# Altium project MONO65_A2_Project.PrjPcb (part 2 of 2)

## Sheet MONO65_A2_s06 [LEDs].SchDoc
size A3; DocumentNumber: 6; SheetNumber: 6; SheetTotal: 7
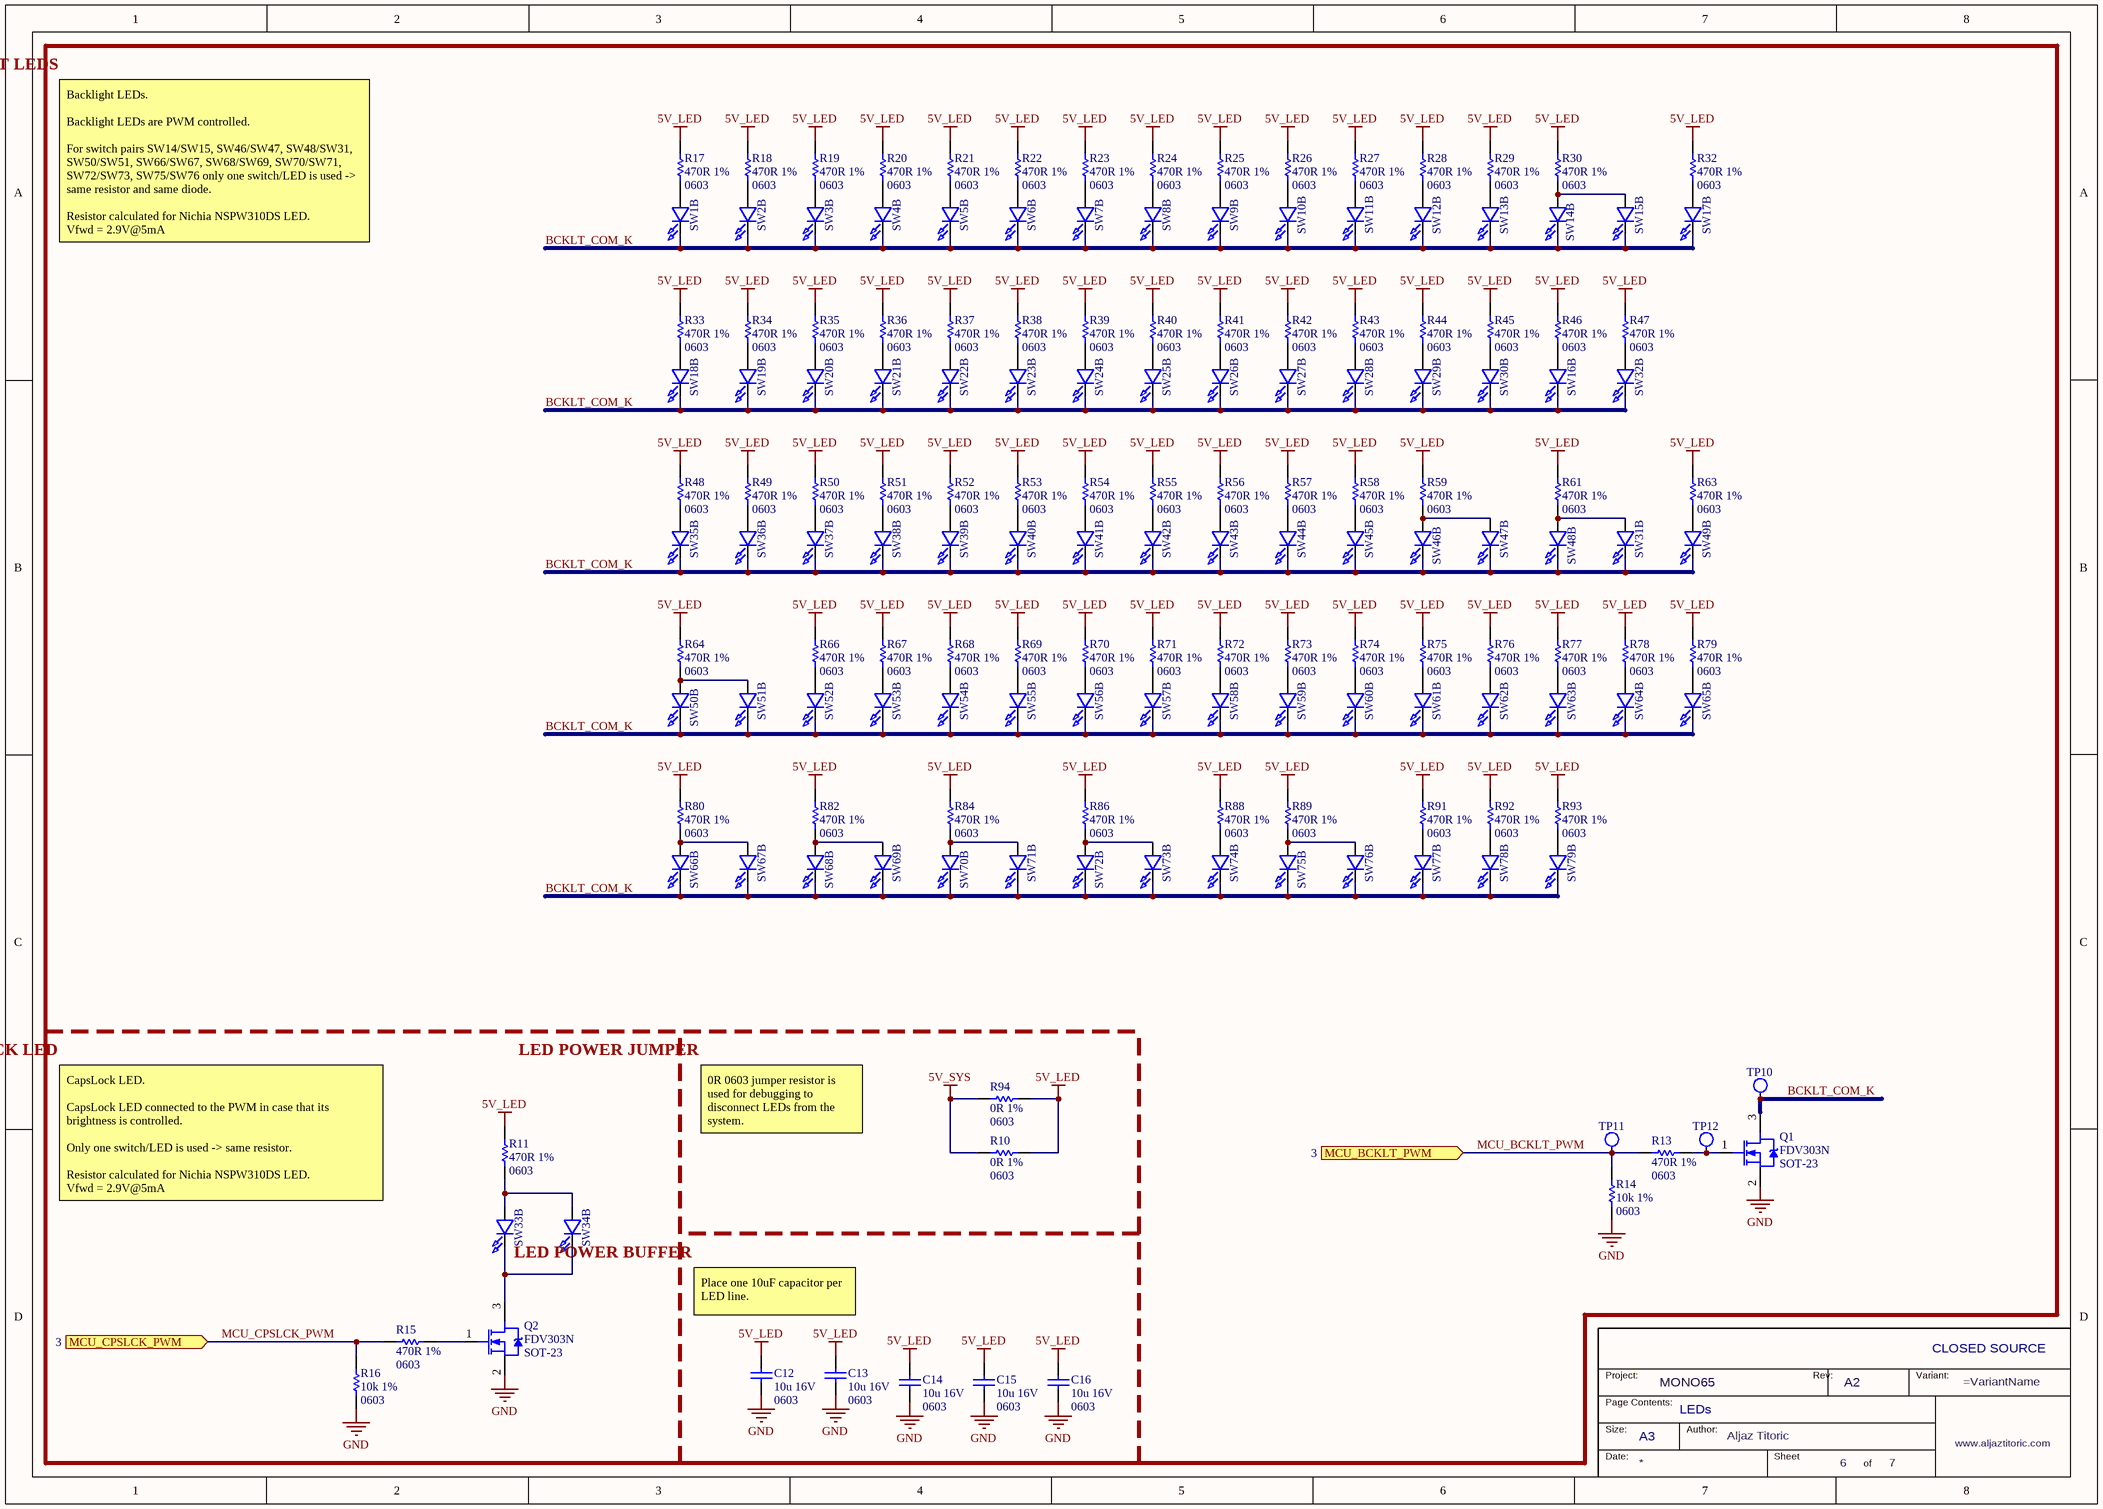
[diagram p5: MONO65_A2_s06 [LEDs].SchDoc]

### Parts
(Parts that share a designator on the sheet are numbered #1, #2 ... from top to bottom, then left to right.)
C12  10u 16V  Case/Package: 0603  [CAPC1608X08N]
C13  10u 16V  Case/Package: 0603  [CAPC1608X08N]
C14  10u 16V  Case/Package: 0603  [CAPC1608X08N]
C15  10u 16V  Case/Package: 0603  [CAPC1608X08N]
C16  10u 16V  Case/Package: 0603  [CAPC1608X08N]
Q1  FDV303N  Case/Package: SOT-23  [SOT95P235X110-3N]
Q2  FDV303N  Case/Package: SOT-23  [SOT95P235X110-3N]
R10  0R 1%  Case/Package: 0603  [RESC1608X04N]
R11  470R 1%  Case/Package: 0603  [RESC1608X04N]
R13  470R 1%  Case/Package: 0603  [RESC1608X04N]
R14  10k 1%  Case/Package: 0603  [RESC1608X04N]
R15  470R 1%  Case/Package: 0603  [RESC1608X04N]
R16  10k 1%  Case/Package: 0603  [RESC1608X04N]
R17  470R 1%  Case/Package: 0603  [RESC1608X04N]
R18  470R 1%  Case/Package: 0603  [RESC1608X04N]
R19  470R 1%  Case/Package: 0603  [RESC1608X04N]
R20  470R 1%  Case/Package: 0603  [RESC1608X04N]
R21  470R 1%  Case/Package: 0603  [RESC1608X04N]
R22  470R 1%  Case/Package: 0603  [RESC1608X04N]
R23  470R 1%  Case/Package: 0603  [RESC1608X04N]
R24  470R 1%  Case/Package: 0603  [RESC1608X04N]
R25  470R 1%  Case/Package: 0603  [RESC1608X04N]
R26  470R 1%  Case/Package: 0603  [RESC1608X04N]
R27  470R 1%  Case/Package: 0603  [RESC1608X04N]
R28  470R 1%  Case/Package: 0603  [RESC1608X04N]
R29  470R 1%  Case/Package: 0603  [RESC1608X04N]
R30  470R 1%  Case/Package: 0603  [RESC1608X04N]
R32  470R 1%  Case/Package: 0603  [RESC1608X04N]
R33  470R 1%  Case/Package: 0603  [RESC1608X04N]
R34  470R 1%  Case/Package: 0603  [RESC1608X04N]
R35  470R 1%  Case/Package: 0603  [RESC1608X04N]
R36  470R 1%  Case/Package: 0603  [RESC1608X04N]
R37  470R 1%  Case/Package: 0603  [RESC1608X04N]
R38  470R 1%  Case/Package: 0603  [RESC1608X04N]
R39  470R 1%  Case/Package: 0603  [RESC1608X04N]
R40  470R 1%  Case/Package: 0603  [RESC1608X04N]
R41  470R 1%  Case/Package: 0603  [RESC1608X04N]
R42  470R 1%  Case/Package: 0603  [RESC1608X04N]
R43  470R 1%  Case/Package: 0603  [RESC1608X04N]
R44  470R 1%  Case/Package: 0603  [RESC1608X04N]
R45  470R 1%  Case/Package: 0603  [RESC1608X04N]
R46  470R 1%  Case/Package: 0603  [RESC1608X04N]
R47  470R 1%  Case/Package: 0603  [RESC1608X04N]
R48  470R 1%  Case/Package: 0603  [RESC1608X04N]
R49  470R 1%  Case/Package: 0603  [RESC1608X04N]
R50  470R 1%  Case/Package: 0603  [RESC1608X04N]
R51  470R 1%  Case/Package: 0603  [RESC1608X04N]
R52  470R 1%  Case/Package: 0603  [RESC1608X04N]
R53  470R 1%  Case/Package: 0603  [RESC1608X04N]
R54  470R 1%  Case/Package: 0603  [RESC1608X04N]
R55  470R 1%  Case/Package: 0603  [RESC1608X04N]
R56  470R 1%  Case/Package: 0603  [RESC1608X04N]
R57  470R 1%  Case/Package: 0603  [RESC1608X04N]
R58  470R 1%  Case/Package: 0603  [RESC1608X04N]
R59  470R 1%  Case/Package: 0603  [RESC1608X04N]
R61  470R 1%  Case/Package: 0603  [RESC1608X04N]
R63  470R 1%  Case/Package: 0603  [RESC1608X04N]
R64  470R 1%  Case/Package: 0603  [RESC1608X04N]
R66  470R 1%  Case/Package: 0603  [RESC1608X04N]
R67  470R 1%  Case/Package: 0603  [RESC1608X04N]
R68  470R 1%  Case/Package: 0603  [RESC1608X04N]
R69  470R 1%  Case/Package: 0603  [RESC1608X04N]
R70  470R 1%  Case/Package: 0603  [RESC1608X04N]
R71  470R 1%  Case/Package: 0603  [RESC1608X04N]
R72  470R 1%  Case/Package: 0603  [RESC1608X04N]
R73  470R 1%  Case/Package: 0603  [RESC1608X04N]
R74  470R 1%  Case/Package: 0603  [RESC1608X04N]
R75  470R 1%  Case/Package: 0603  [RESC1608X04N]
R76  470R 1%  Case/Package: 0603  [RESC1608X04N]
R77  470R 1%  Case/Package: 0603  [RESC1608X04N]
R78  470R 1%  Case/Package: 0603  [RESC1608X04N]
R79  470R 1%  Case/Package: 0603  [RESC1608X04N]
R80  470R 1%  Case/Package: 0603  [RESC1608X04N]
R82  470R 1%  Case/Package: 0603  [RESC1608X04N]
R84  470R 1%  Case/Package: 0603  [RESC1608X04N]
R86  470R 1%  Case/Package: 0603  [RESC1608X04N]
R88  470R 1%  Case/Package: 0603  [RESC1608X04N]
R89  470R 1%  Case/Package: 0603  [RESC1608X04N]
R91  470R 1%  Case/Package: 0603  [RESC1608X04N]
R92  470R 1%  Case/Package: 0603  [RESC1608X04N]
R93  470R 1%  Case/Package: 0603  [RESC1608X04N]
R94  0R 1%  Case/Package: 0603  [RESC1608X04N]
SW1  MX1A-11GW  [MX1A-1-LED-Pins]  (value not drawn)  (part B of 2)
SW2  MX1A-11GW  [MX1A-1-LED-Pins]  (value not drawn)  (part B of 2)
SW3  MX1A-11GW  [MX1A-1-LED-Pins]  (value not drawn)  (part B of 2)
SW4  MX1A-11GW  [MX1A-1-LED-Pins]  (value not drawn)  (part B of 2)
SW5  MX1A-11GW  [MX1A-1-LED-Pins]  (value not drawn)  (part B of 2)
SW6  MX1A-11GW  [MX1A-1-LED-Pins]  (value not drawn)  (part B of 2)
SW7  MX1A-11GW  [MX1A-1-LED-Pins]  (value not drawn)  (part B of 2)
SW8  MX1A-11GW  [MX1A-1-LED-Pins]  (value not drawn)  (part B of 2)
SW9  MX1A-11GW  [MX1A-1-LED-Pins]  (value not drawn)  (part B of 2)
SW10  MX1A-11GW  [MX1A-1-LED-Pins]  (value not drawn)  (part B of 2)
SW11  MX1A-11GW  [MX1A-1-LED-Pins]  (value not drawn)  (part B of 2)
SW12  MX1A-11GW  [MX1A-1-LED-Pins]  (value not drawn)  (part B of 2)
SW13  MX1A-11GW  [MX1A-1-LED-Pins]  (value not drawn)  (part B of 2)
SW14  MX1A-11GW  [MX1A-1-LED-Pins]  (value not drawn)  (part B of 2)
SW15  MX1A-11GW  [MX1A-1-LED-Pins]  (value not drawn)  (part B of 2)
SW16  MX1A-11GW  [MX1A-1-LED-Pins]  (value not drawn)  (part B of 2)
SW17  MX1A-11GW  [MX1A-1-LED-Pins]  (value not drawn)  (part B of 2)
SW18  MX1A-11GW  [MX1A-1-LED-Pins]  (value not drawn)  (part B of 2)
SW19  MX1A-11GW  [MX1A-1-LED-Pins]  (value not drawn)  (part B of 2)
SW20  MX1A-11GW  [MX1A-1-LED-Pins]  (value not drawn)  (part B of 2)
SW21  MX1A-11GW  [MX1A-1-LED-Pins]  (value not drawn)  (part B of 2)
SW22  MX1A-11GW  [MX1A-1-LED-Pins]  (value not drawn)  (part B of 2)
SW23  MX1A-11GW  [MX1A-1-LED-Pins]  (value not drawn)  (part B of 2)
SW24  MX1A-11GW  [MX1A-1-LED-Pins]  (value not drawn)  (part B of 2)
SW25  MX1A-11GW  [MX1A-1-LED-Pins]  (value not drawn)  (part B of 2)
SW26  MX1A-11GW  [MX1A-1-LED-Pins]  (value not drawn)  (part B of 2)
SW27  MX1A-11GW  [MX1A-1-LED-Pins]  (value not drawn)  (part B of 2)
SW28  MX1A-11GW  [MX1A-1-LED-Pins]  (value not drawn)  (part B of 2)
SW29  MX1A-11GW  [MX1A-1-LED-Pins]  (value not drawn)  (part B of 2)
SW30  MX1A-11GW  [MX1A-1-LED-Pins]  (value not drawn)  (part B of 2)
SW31  MX1A-11GW  [MX1A-1-LED-Pins]  (value not drawn)  (part B of 2)
SW32  MX1A-11GW  [MX1A-1-LED-Pins]  (value not drawn)  (part B of 2)
SW33  MX1A-11GW  [MX1A-1-LED-Pins]  (value not drawn)  (part B of 2)
SW34  MX1A-11GW  [MX1A-1-LED-Pins]  (value not drawn)  (part B of 2)
SW35  MX1A-11GW  [MX1A-1-LED-Pins]  (value not drawn)  (part B of 2)
SW36  MX1A-11GW  [MX1A-1-LED-Pins]  (value not drawn)  (part B of 2)
SW37  MX1A-11GW  [MX1A-1-LED-Pins]  (value not drawn)  (part B of 2)
SW38  MX1A-11GW  [MX1A-1-LED-Pins]  (value not drawn)  (part B of 2)
SW39  MX1A-11GW  [MX1A-1-LED-Pins]  (value not drawn)  (part B of 2)
SW40  MX1A-11GW  [MX1A-1-LED-Pins]  (value not drawn)  (part B of 2)
SW41  MX1A-11GW  [MX1A-1-LED-Pins]  (value not drawn)  (part B of 2)
SW42  MX1A-11GW  [MX1A-1-LED-Pins]  (value not drawn)  (part B of 2)
SW43  MX1A-11GW  [MX1A-1-LED-Pins]  (value not drawn)  (part B of 2)
SW44  MX1A-11GW  [MX1A-1-LED-Pins]  (value not drawn)  (part B of 2)
SW45  MX1A-11GW  [MX1A-1-LED-Pins]  (value not drawn)  (part B of 2)
SW46  MX1A-11GW  [MX1A-1-LED-Pins]  (value not drawn)  (part B of 2)
SW47  MX1A-11GW  [MX1A-1-LED-Pins]  (value not drawn)  (part B of 2)
SW48  MX1A-11GW  [MX1A-1-LED-Pins]  (value not drawn)  (part B of 2)
SW49  MX1A-11GW  [MX1A-1-LED-Pins]  (value not drawn)  (part B of 2)
SW50  MX1A-11GW  [MX1A-1-LED-Pins]  (value not drawn)  (part B of 2)
SW51  MX1A-11GW  [MX1A-1-LED-Pins]  (value not drawn)  (part B of 2)
SW52  MX1A-11GW  [MX1A-1-LED-Pins]  (value not drawn)  (part B of 2)
SW53  MX1A-11GW  [MX1A-1-LED-Pins]  (value not drawn)  (part B of 2)
SW54  MX1A-11GW  [MX1A-1-LED-Pins]  (value not drawn)  (part B of 2)
SW55  MX1A-11GW  [MX1A-1-LED-Pins]  (value not drawn)  (part B of 2)
SW56  MX1A-11GW  [MX1A-1-LED-Pins]  (value not drawn)  (part B of 2)
SW57  MX1A-11GW  [MX1A-1-LED-Pins]  (value not drawn)  (part B of 2)
SW58  MX1A-11GW  [MX1A-1-LED-Pins]  (value not drawn)  (part B of 2)
SW59  MX1A-11GW  [MX1A-1-LED-Pins]  (value not drawn)  (part B of 2)
SW60  MX1A-11GW  [MX1A-1-LED-Pins]  (value not drawn)  (part B of 2)
SW61  MX1A-11GW  [MX1A-1-LED-Pins]  (value not drawn)  (part B of 2)
SW62  MX1A-11GW  [MX1A-1-LED-Pins]  (value not drawn)  (part B of 2)
SW63  MX1A-11GW  [MX1A-1-LED-Pins]  (value not drawn)  (part B of 2)
SW64  MX1A-11GW  [MX1A-1-LED-Pins]  (value not drawn)  (part B of 2)
SW65  MX1A-11GW  [MX1A-1-LED-Pins]  (value not drawn)  (part B of 2)
SW66  MX1A-11GW  [MX1A-1-LED-Pins]  (value not drawn)  (part B of 2)
SW67  MX1A-11GW  [MX1A-1-reversed LED-Pins]  (value not drawn)  (part B of 2)
SW68  MX1A-11GW  [MX1A-1-LED-Pins]  (value not drawn)  (part B of 2)
SW69  MX1A-11GW  [MX1A-1-reversed LED-Pins]  (value not drawn)  (part B of 2)
SW70  MX1A-11GW  [MX1A-1-LED-Pins]  (value not drawn)  (part B of 2)
SW71  MX1A-11GW  [MX1A-1-reversed LED-Pins]  (value not drawn)  (part B of 2)
SW72  MX1A-11GW  [MX1A-1-LED-Pins]  (value not drawn)  (part B of 2)
SW73  MX1A-11GW  [MX1A-1-LED-Pins]  (value not drawn)  (part B of 2)
SW74  MX1A-11GW  [MX1A-1-LED-Pins]  (value not drawn)  (part B of 2)
SW75  MX1A-11GW  [MX1A-1-LED-Pins]  (value not drawn)  (part B of 2)
SW76  MX1A-11GW  [MX1A-1-reversed LED-Pins]  (value not drawn)  (part B of 2)
SW77  MX1A-11GW  [MX1A-1-LED-Pins]  (value not drawn)  (part B of 2)
SW78  MX1A-11GW  [MX1A-1-LED-Pins]  (value not drawn)  (part B of 2)
SW79  MX1A-11GW  [MX1A-1-LED-Pins]  (value not drawn)  (part B of 2)
TB*?#5  PageContents: LEDs  Licence: CLOSED SOURCE  Size: A3  (hidden comment: TBL TitleBlock 01)  (graphical)
TP10  TP SMD 0.6mm  [TP SMD 0.6mm]  (value not drawn)  (no BOM)
TP11  TP SMD 0.6mm  [TP SMD 0.6mm]  (value not drawn)  (no BOM)
TP12  TP SMD 0.6mm  [TP SMD 0.6mm]  (value not drawn)  (no BOM)

### Ports
MCU_BCKLT_PWM (in, see 3), MCU_CPSLCK_PWM (in, see 3)

### Nets
5V_LED: C12.1 C13.1 C14.1 C15.1 C16.1 R10.2 R11.1 R17.1 R18.1 R19.1 R20.1 R21.1 R22.1 R23.1 R24.1 R25.1 R26.1 R27.1 R28.1 R29.1 R30.1 R32.1 R33.1 R34.1 R35.1 R36.1 R37.1 R38.1 R39.1 R40.1 R41.1 R42.1 R43.1 R44.1 R45.1 R46.1 R47.1 R48.1 R49.1 R50.1 R51.1 R52.1 R53.1 R54.1 R55.1 R56.1 R57.1 R58.1 R59.1 R61.1 R63.1 R64.1 R66.1 R67.1 R68.1 R69.1 R70.1 R71.1 R72.1 R73.1 R74.1 R75.1 R76.1 R77.1 R78.1 R79.1 R80.1 R82.1 R84.1 R86.1 R88.1 R89.1 R91.1 R92.1 R93.1 R94.2
5V_SYS: R10.1 R94.1
GND: C12.2 C13.2 C14.2 C15.2 C16.2 Q1.2(S) Q2.2(S) R14.2 R16.2
BCKLT_COM_K: Q1.3(D) SW1.4(K) SW2.4(K) SW3.4(K) SW4.4(K) SW5.4(K) SW6.4(K) SW7.4(K) SW8.4(K) SW9.4(K) SW10.4(K) SW11.4(K) SW12.4(K) SW13.4(K) SW14.4(K) SW15.4(K) SW16.4(K) SW17.4(K) SW18.4(K) SW19.4(K) SW20.4(K) SW21.4(K) SW22.4(K) SW23.4(K) SW24.4(K) SW25.4(K) SW26.4(K) SW27.4(K) SW28.4(K) SW29.4(K) SW30.4(K) SW31.4(K) SW32.4(K) SW35.4(K) SW36.4(K) SW37.4(K) SW38.4(K) SW39.4(K) SW40.4(K) SW41.4(K) SW42.4(K) SW43.4(K) SW44.4(K) SW45.4(K) SW46.4(K) SW47.4(K) SW48.4(K) SW49.4(K) SW50.4(K) SW51.4(K) SW52.4(K) SW53.4(K) SW54.4(K) SW55.4(K) SW56.4(K) SW57.4(K) SW58.4(K) SW59.4(K) SW60.4(K) SW61.4(K) SW62.4(K) SW63.4(K) SW64.4(K) SW65.4(K) SW66.4(K) SW67.4(K) SW68.4(K) SW69.4(K) SW70.4(K) SW71.4(K) SW72.4(K) SW73.4(K) SW74.4(K) SW75.4(K) SW76.4(K) SW77.4(K) SW78.4(K) SW79.4(K) TP10.1
MCU_BCKLT_PWM: R13.1 R14.1 TP11.1 ; port MCU_BCKLT_PWM
MCU_CPSLCK_PWM: R15.1 R16.1 ; port MCU_CPSLCK_PWM
NetQ1_1: Q1.1(G) R13.2 TP12.1
NetQ2_1: Q2.1(G) R15.2
NetQ2_3: Q2.3(D) SW33.4(K) SW34.4(K)
NetR11_2: R11.2 SW33.3(A) SW34.3(A)
NetR17_2: R17.2 SW1.3(A)
NetR18_2: R18.2 SW2.3(A)
NetR19_2: R19.2 SW3.3(A)
NetR20_2: R20.2 SW4.3(A)
NetR21_2: R21.2 SW5.3(A)
NetR22_2: R22.2 SW6.3(A)
NetR23_2: R23.2 SW7.3(A)
NetR24_2: R24.2 SW8.3(A)
NetR25_2: R25.2 SW9.3(A)
NetR26_2: R26.2 SW10.3(A)
NetR27_2: R27.2 SW11.3(A)
NetR28_2: R28.2 SW12.3(A)
NetR29_2: R29.2 SW13.3(A)
NetR30_2: R30.2 SW14.3(A) SW15.3(A)
NetR32_2: R32.2 SW17.3(A)
NetR33_2: R33.2 SW18.3(A)
NetR34_2: R34.2 SW19.3(A)
NetR35_2: R35.2 SW20.3(A)
NetR36_2: R36.2 SW21.3(A)
NetR37_2: R37.2 SW22.3(A)
NetR38_2: R38.2 SW23.3(A)
NetR39_2: R39.2 SW24.3(A)
NetR40_2: R40.2 SW25.3(A)
NetR41_2: R41.2 SW26.3(A)
NetR42_2: R42.2 SW27.3(A)
NetR43_2: R43.2 SW28.3(A)
NetR44_2: R44.2 SW29.3(A)
NetR45_2: R45.2 SW30.3(A)
NetR46_2: R46.2 SW16.3(A)
NetR47_2: R47.2 SW32.3(A)
NetR48_2: R48.2 SW35.3(A)
NetR49_2: R49.2 SW36.3(A)
NetR50_2: R50.2 SW37.3(A)
NetR51_2: R51.2 SW38.3(A)
NetR52_2: R52.2 SW39.3(A)
NetR53_2: R53.2 SW40.3(A)
NetR54_2: R54.2 SW41.3(A)
NetR55_2: R55.2 SW42.3(A)
NetR56_2: R56.2 SW43.3(A)
NetR57_2: R57.2 SW44.3(A)
NetR58_2: R58.2 SW45.3(A)
NetR59_2: R59.2 SW46.3(A) SW47.3(A)
NetR61_2: R61.2 SW31.3(A) SW48.3(A)
NetR63_2: R63.2 SW49.3(A)
NetR64_2: R64.2 SW50.3(A) SW51.3(A)
NetR66_2: R66.2 SW52.3(A)
NetR67_2: R67.2 SW53.3(A)
NetR68_2: R68.2 SW54.3(A)
NetR69_2: R69.2 SW55.3(A)
NetR70_2: R70.2 SW56.3(A)
NetR71_2: R71.2 SW57.3(A)
NetR72_2: R72.2 SW58.3(A)
NetR73_2: R73.2 SW59.3(A)
NetR74_2: R74.2 SW60.3(A)
NetR75_2: R75.2 SW61.3(A)
NetR76_2: R76.2 SW62.3(A)
NetR77_2: R77.2 SW63.3(A)
NetR78_2: R78.2 SW64.3(A)
NetR79_2: R79.2 SW65.3(A)
NetR80_2: R80.2 SW66.3(A) SW67.3(A)
NetR82_2: R82.2 SW68.3(A) SW69.3(A)
NetR84_2: R84.2 SW70.3(A) SW71.3(A)
NetR86_2: R86.2 SW72.3(A) SW73.3(A)
NetR88_2: R88.2 SW74.3(A)
NetR89_2: R89.2 SW75.3(A) SW76.3(A)
NetR91_2: R91.2 SW77.3(A)
NetR92_2: R92.2 SW78.3(A)
NetR93_2: R93.2 SW79.3(A)

### Notes on the sheet
- BACKLIGHT LEDS
- Backlight LEDs.
  Backlight LEDs are PWM controlled.
  For switch pairs SW14/SW15, SW46/SW47, SW48/SW31, SW50/SW51, SW66/SW67, SW68/SW69, SW70/SW71, SW72/SW73, SW75/SW76 only one switch/LED is used -> same resistor and same diode.
  Resistor calculated for Nichia NSPW310DS LED.
  Vfwd = 2.9V@5mA
- CAPS LOCK LED
- LED POWER JUMPER
- 0R 0603 jumper resistor is used for debugging to disconnect LEDs from the system.
- CapsLock LED.
  CapsLock LED connected to the PWM in case that its brightness is controlled.
  Only one switch/LED is used -> same resistor.
  Resistor calculated for Nichia NSPW310DS LED.
  Vfwd = 2.9V@5mA
- LED POWER BUFFER
- Place one 10uF capacitor per LED line.
- (in symbol TBL TitleBlock 01) Project:; Rev:; Variant:; Page Contents:; Size:; Author:; Date:; Sheet; of

### Library data of the parts
C12-C16 = CAP SMD CER 10u 16V X5R 0603: SMD CAPACITOR,10u, 16V, X5R, 0603; Manufacturer: Murata; Manufacturer Part Number: GRM188R61C106MA73D; Capacitance: 10uF; Tolerance: 20%; Supplier 1: Digi-Key; Stock 1: 24451; Pricing 1: 1 = 0,31000, 10 = 0,21500, 50 = 0,14340, 100 = 0,12190, 500 = 0,08604, 1000 = 0,07528 (USD); RoHS: Yes; Mount: Surface Mount; Case Code (Metric): 1608; Case Code (Imperial): 0603; Min Operating Temperature: -55°C; Max Operating Temperature: 85°C; Package Quantity: 4000; Packaging: Tape and Reel; Voltage Rating: 16V; Dielectric: X5R; Voltage: 16V; Voltage Rating (DC): 16V; Series: GRM; Length: 1.6mm; Width: 0.031inch; Height: 0.8mm; Thickness: 0.031inch; Depth: 0.8mm; REACH SVHC: No SVHC; Lead Free: Lead Free; RoHS Compliant: Yes; ComponentLink1URL: https://datasheet.ciiva.com/46444/1769893-46444981.pdf?src-supplier=Element14; ComponentLink1Description: https://datasheet.ciiva.com/46444/1769893-46444981.pdf?src-supplier=Element14; ComponentLink2URL: https://datasheet.ciiva.com/14906/partnumbering-e-01-14906479.pdf?src-supplier=Digi-Key; ComponentLink2Description: https://datasheet.ciiva.com/14906/partnumbering-e-01-14906479.pdf?src-supplier=Digi-Key; Supplier Part Number 1: 490-7201-1-ND
Q1 Q2 = SEM MOS N-CH 25V 680mA FDV303N: N-Channel MOSFET, 680 mA, 25 V, SOT-23-3, ON Semiconductor FDV303N; Manufacturer: ON Semiconductor / Fairchild; Rise Time: 8.5ns; Element Configuration: Single; Continuous Drain Current (ID): 680mA; Drain to Source Breakdown Voltage: 25V; Gate to Source Voltage (Vgs): 8V; Drain to Source Resistance: 450mR; Power Dissipation: 350mW; Turn-Off Delay Time: 17ns; Input Capacitance: 50pF; Turn-On Delay Time: 3ns; Nominal Vgs: 800mV; Number of Elements: 1; Current: 12A; Voltage: 20V; Supplier 1: Digi-Key; Manufacturer Part Number: FDV303N; Stock 1: 569121; Pricing 1: 1 = 0,36000, 10 = 0,29600, 25 = 0,24760, 100 = 0,12100, 250 = 0,11908, 500 = 0,10092, 1000 = 0,07013 (USD); RoHS: Yes; Mount: Surface Mount; Number of Pins: 3; Contact Plating: Tin,Matte; Min Operating Temperature: -55°C; Max Operating Temperature: 150°C; Packaging: Tape and Reel; Fall Time: 8.5ns; Package Quantity: 1; Rds On Max: 450mR; Max Power Dissipation: 350mW; Drain to Source Voltage (Vdss): 25V; Threshold Voltage: 800mV; Voltage Rating (DC): 25V; Current Rating: 680mA; On-State Resistance: 450mR; Dual Supply Voltage: 25V; Termination: SMD/SMT; Length: 2.92mm; Height: 0.93mm; Width: 3.05mm; Radiation Hardening: No; REACH SVHC: No SVHC; Lead Free: Lead Free; ComponentLink1URL: https://datasheet.ciiva.com/15137/getdatasheetpartid-90649-15137711.pdf?src-supplier=Verical; ComponentLink1Description: https://datasheet.ciiva.com/15137/getdatasheetpartid-90649-15137711.pdf?src-supplier=Verical; ComponentLink2URL: https://datasheet.ciiva.com/8114/fdv303n-8114704.pdf?src-supplier=Avnet; ComponentLink2Description: https://datasheet.ciiva.com/8114/fdv303n-8114704.pdf?src-supplier=Avnet; ComponentLink3URL: https://datasheet.ciiva.com/13052/fdv303n-108963-13052385.pdf?src-supplier=Mouser; ComponentLink3Description: https://datasheet.ciiva.com/13052/fdv303n-108963-13052385.pdf?src-supplier=Mouser; ComponentLink4URL: https://datasheet.ciiva.com/22681/1845307-22681736.pdf?src-supplier=Element14; ComponentLink4Description: https://datasheet.ciiva.com/22681/1845307-22681736.pdf?src-supplier=Element14; ComponentLink5URL: https://datasheet.ciiva.com/34301/871092-34301626.pdf?src-supplier=Jameco; ComponentLink5Description: https://datasheet.ciiva.com/34301/871092-34301626.pdf?src-supplier=Jameco; ComponentLink6URL: https://datasheet.ciiva.com/931/fdv303n-931809.pdf?src-supplier=Digi-Key; ComponentLink6Description: https://datasheet.ciiva.com/931/fdv303n-931809.pdf?src-supplier=Digi-Key; ComponentLink7URL: https://datasheet.ciiva.com/6037/fdv303n-6037406.pdf?src-supplier=Farnell; ComponentLink7Description: https://datasheet.ciiva.com/6037/fdv303n-6037406.pdf?src-supplier=Farnell; ComponentLink8URL: https://datasheet.ciiva.com/931/fdv303n-931810.pdf?src-supplier=Digi-Key; ComponentLink8Description: https://datasheet.ciiva.com/931/fdv303n-931810.pdf?src-supplier=Digi-Key; ComponentLink9URL: https://datasheet.ciiva.com/931/fdv303n-931811.pdf?src-supplier=Digi-Key; ComponentLink9Description: https://datasheet.ciiva.com/931/fdv303n-931811.pdf?src-supplier=Digi-Key; ComponentLink10URL: https://datasheet.ciiva.com/14092/fdv303n-eng-tds-14092037.pdf?src-supplier=Distrelec; ComponentLink10Description: https://datasheet.ciiva.com/14092/fdv303n-eng-tds-14092037.pdf?src-supplier=Distrelec; ComponentLink11URL: https://datasheet.ciiva.com/16958/fdv303n-16958487.pdf?src-supplier=Future+Electronics; ComponentLink11Description: https://datasheet.ciiva.com/16958/fdv303n-16958487.pdf?src-supplier=Future+Electronics; ComponentLink12URL: https://datasheet.ciiva.com/6037/fdv303n-6037404.pdf?src-supplier=Farnell; ComponentLink12Description: https://datasheet.ciiva.com/6037/fdv303n-6037404.pdf?src-supplier=Farnell; ComponentLink13URL: https://datasheet.ciiva.com/8114/fdv303n-8114700.pdf?src-supplier=Avnet; ComponentLink13Description: https://datasheet.ciiva.com/8114/fdv303n-8114700.pdf?src-supplier=Avnet; Supplier Part Number 1: FDV303NCT-ND
R10 R94 = RES SMD 0R 1% 0603: SMD RESISTOR 0R 1% 0603 0.1W; Manufacturer: Yageo; Manufacturer Part Number: RC0603JR-070RL; Resistance: 0mR; Power Rating: 100mW; Voltage Rating: 50V; Temperature Coefficient: 200ppm/°C; Supplier 1: Digi-Key; Stock 1: 22182575; Pricing 1: 1 = 0,10000, 10 = 0,01900, 25 = 0,01360, 50 = 0,01040, 100 = 0,00770, 250 = 0,00588, 500 = 0,00472, 1000 = 0,00347 (USD); RoHS: Yes; Number of Pins: 2; Case Code (Imperial): 0603; Case Code (Metric): 1608; Contact Plating: Tin,Matte; Min Operating Temperature: -55°C; Max Operating Temperature: 155°C; Packaging: Tape and Reel; Voltage Rating (DC): 50V; Composition: Thick Film; Tolerance: 1%; Military Standard: Not; Package Quantity: 5000; Termination: SMD/SMT; Length: 1.6mm; Height: 0.45mm; Width: 0.8mm; Depth: 0.8mm; Radiation Hardening: No; REACH SVHC: No SVHC; Lead Free: Lead Free; ComponentLink1URL: https://datasheet.ciiva.com/11808/pyu-r-int-6-11808700.pdf?src-supplier=RSComponents; ComponentLink1Description: https://datasheet.ciiva.com/11808/pyu-r-int-6-11808700.pdf?src-supplier=RSComponents; ComponentLink2URL: https://datasheet.ciiva.com/7746/1738695-7746421.pdf?src-supplier=Element14; ComponentLink2Description: https://datasheet.ciiva.com/7746/1738695-7746421.pdf?src-supplier=Element14; ComponentLink3URL: https://datasheet.ciiva.com/8883/pyu-rc0603-51-rohs-l-4-8883045.pdf?src-supplier=Avnet; ComponentLink3Description: https://datasheet.ciiva.com/8883/pyu-rc0603-51-rohs-l-4-8883045.pdf?src-supplier=Avnet; ComponentLink4URL: https://datasheet.ciiva.com/15189/getdatasheetpartid-329462-15189845.pdf?src-supplier=Verical; ComponentLink4Description: https://datasheet.ciiva.com/15189/getdatasheetpartid-329462-15189845.pdf?src-supplier=Verical; ComponentLink5URL: https://datasheet.ciiva.com/7746/1738695-7746422.pdf?src-supplier=Element14; ComponentLink5Description: https://datasheet.ciiva.com/7746/1738695-7746422.pdf?src-supplier=Element14; ComponentLink6URL: https://datasheet.ciiva.com/12555/rc0603-272842-12555254.pdf?src-supplier=Mouser; ComponentLink6Description: https://datasheet.ciiva.com/12555/rc0603-272842-12555254.pdf?src-supplier=Mouser; ComponentLink7URL: https://datasheet.ciiva.com/22747/443971-22747530.pdf?src-supplier=Element14; ComponentLink7Description: https://datasheet.ciiva.com/22747/443971-22747530.pdf?src-supplier=Element14; Supplier Part Number 1: 311-0.0GRDKR-ND
R11 R13 R15 R17-R30 R32-R59 R61 R63 R64 R66-R80 R82 R84 R86 R88 R89 R91-R93 = RES SMD 470R 1% 0603: SMD RESISTOR 470R 1% 0603 0.1W; Manufacturer: Yageo; Manufacturer Part Number: RC0603FR-07470RL; Power Rating: 100mW; Voltage Rating: 50V; Temperature Coefficient: 100ppm/°C; Working Voltage: 75V; Supplier 1: Digi-Key; Stock 1: 512962; Pricing 1: 1 = 0,10000, 10 = 0,02300, 100 = 0,00930, 1000 = 0,00417, 2500 = 0,00362 (USD); RoHS: Yes; Case Code (Metric): 1608; Case Code (Imperial): 0603; Min Operating Temperature: -55°C; Max Operating Temperature: 155°C; Tolerance: 1%; Resistance: 470R; Packaging: Tape and Reel; Package Quantity: 1; Resistor Type: Thick Film; Number of Terminations: 2; Termination: SMD/SMT; Max Power Dissipation: 100mW; Features: Moisture Resistant; Series: RC; Technology: THICK FILM; Resistance Tolerance: 1%; Construction: Rectangular; Length: 1.6mm; Width: 0.031inch; Height: 0.022inch; Depth: 0.8mm; RoHS Compliant: Yes; REACH SVHC: No SVHC; Military Standard: Not; Lead Free: Lead Free; ComponentLink1URL: https://datasheet.ciiva.com/11808/0900766b80f96399-11808177.pdf?src-supplier=RSComponents; ComponentLink1Description: https://datasheet.ciiva.com/11808/0900766b80f96399-11808177.pdf?src-supplier=RSComponents; ComponentLink2URL: https://datasheet.ciiva.com/7746/1738695-7746359.pdf?src-supplier=Element14; ComponentLink2Description: https://datasheet.ciiva.com/7746/1738695-7746359.pdf?src-supplier=Element14; ComponentLink3URL: https://datasheet.ciiva.com/7746/1738695-7746360.pdf?src-supplier=Element14; ComponentLink3Description: https://datasheet.ciiva.com/7746/1738695-7746360.pdf?src-supplier=Element14; ComponentLink4URL: https://datasheet.ciiva.com/7660/1868787-7660793.pdf?src-supplier=Element14; ComponentLink4Description: https://datasheet.ciiva.com/7660/1868787-7660793.pdf?src-supplier=Element14; ComponentLink5URL: https://datasheet.ciiva.com/46440/1868787-46440907.pdf?src-supplier=Element14; ComponentLink5Description: https://datasheet.ciiva.com/46440/1868787-46440907.pdf?src-supplier=Element14; ComponentLink6URL: https://datasheet.ciiva.com/2454/pyu-r-int-thick-7-2454012.pdf?src-supplier=Digi-Key; ComponentLink6Description: https://datasheet.ciiva.com/2454/pyu-r-int-thick-7-2454012.pdf?src-supplier=Digi-Key; ComponentLink7URL: https://datasheet.ciiva.com/2454/pyu-r-int-thick-7-2454013.pdf?src-supplier=Digi-Key; ComponentLink7Description: https://datasheet.ciiva.com/2454/pyu-r-int-thick-7-2454013.pdf?src-supplier=Digi-Key; ComponentLink8URL: https://datasheet.ciiva.com/2454/pyu-r-int-thick-7-2454014.pdf?src-supplier=Digi-Key; ComponentLink8Description: https://datasheet.ciiva.com/2454/pyu-r-int-thick-7-2454014.pdf?src-supplier=Digi-Key; Supplier Part Number 1: 311-470HRCT-ND
R14 R16 = RES SMD 10k 1% 0603: SMD RESISTOR 10k 1% 0603 0.1W; Manufacturer: Panasonic; Manufacturer Part Number: ERJ-3EKF1002V; Resistance: 10kR; Power Rating: 100mW; Temperature Coefficient: 100ppm/°C; Voltage Rating: 75V; Supplier 1: Digi-Key; Stock 1: 1973326; Pricing 1: 1 = 0,10000, 10 = 0,06000, 100 = 0,02440, 1000 = 0,01094, 2500 = 0,00950 (USD); RoHS: Yes; Mount: Surface Mount; Number of Pins: 2; Case Code (Metric): 1608; Case Code (Imperial): 0603; Contact Plating: Tin; Min Operating Temperature: -55°C; Max Operating Temperature: 155°C; Tolerance: 1%; Packaging: Tape and Reel; Composition: Thick Film; Termination: SMD/SMT; Package Quantity: 1; Max Power Dissipation: 100mW; Military Standard: Not; Number of Terminations: 2; Voltage Rating (DC): 75V; Features: Automotive AEC-Q200; Length: 1.6mm; Height: 0.45mm; Width: 0.031inch; Depth: 0.8mm; Radiation Hardening: No; Lead Free: Lead Free; REACH SVHC: No SVHC; ComponentLink1URL: https://datasheet.ciiva.com/7830/aoa0000ce2-7830729.pdf?src-supplier=Element14; ComponentLink1Description: https://datasheet.ciiva.com/7830/aoa0000ce2-7830729.pdf?src-supplier=Element14; ComponentLink2URL: https://datasheet.ciiva.com/17212/aoa0000ce2-17212105.pdf?src-supplier=Avnet+Europe; ComponentLink2Description: https://datasheet.ciiva.com/17212/aoa0000ce2-17212105.pdf?src-supplier=Avnet+Europe; ComponentLink3URL: https://datasheet.ciiva.com/48530/aoa0000ce2-48530988.pdf?src-supplier=Avnet; ComponentLink3Description: https://datasheet.ciiva.com/48530/aoa0000ce2-48530988.pdf?src-supplier=Avnet; ComponentLink4URL: https://datasheet.ciiva.com/24070/aoa0000ce2-24070318.pdf?src-supplier=Mouser; ComponentLink4Description: https://datasheet.ciiva.com/24070/aoa0000ce2-24070318.pdf?src-supplier=Mouser; ComponentLink5URL: https://datasheet.ciiva.com/16759/70260748-16759807.pdf?src-supplier=Allied+Electronics; ComponentLink5Description: https://datasheet.ciiva.com/16759/70260748-16759807.pdf?src-supplier=Allied+Electronics; ComponentLink6URL: https://datasheet.ciiva.com/16511/aoa0000ce2-16511861.pdf?src-supplier=Avnet+Asia; ComponentLink6Description: https://datasheet.ciiva.com/16511/aoa0000ce2-16511861.pdf?src-supplier=Avnet+Asia; ComponentLink7URL: https://datasheet.ciiva.com/46372/1678782-46372725.pdf?src-supplier=Element14; ComponentLink7Description: https://datasheet.ciiva.com/46372/1678782-46372725.pdf?src-supplier=Element14; ComponentLink8URL: https://datasheet.ciiva.com/28514/426256-28514198.pdf?src-supplier=Element14; ComponentLink8Description: https://datasheet.ciiva.com/28514/426256-28514198.pdf?src-supplier=Element14; ComponentLink9URL: https://datasheet.ciiva.com/9194/aoa0000ce2-9194199.pdf?src-supplier=Avnet; ComponentLink9Description: https://datasheet.ciiva.com/9194/aoa0000ce2-9194199.pdf?src-supplier=Avnet; ComponentLink10URL: https://datasheet.ciiva.com/30208/aoa0000ce2-30208985.pdf?src-supplier=Onlinecomponents.com; ComponentLink10Description: https://datasheet.ciiva.com/30208/aoa0000ce2-30208985.pdf?src-supplier=Onlinecomponents.com; Supplier Part Number 1: P10.0KHDKR-ND
SW1-SW79 = SW MX1A-11GW: Cherry MX switch, 1-pole w/LED, w/fixation pins, GREEN LED; Supplier 1: Digi-Key; Manufacturer: Cherry; Manufacturer Part Number: MX1A-11GW; Stock 1: 0; Pricing 1: 8000 = 1,62196 (USD); RoHS: No; Supplier Part Number 1: MX1A-11GW-ND
TB*?#5 = TBL TitleBlock 01: Custom Title block
TP10-TP12 = TPT SMD 60: Test Point SMD 0.6mm

## Sheet MONO65_A2_s07 [PSU].SchDoc
size A3; DocumentNumber: 7; SheetNumber: 7; SheetTotal: 7
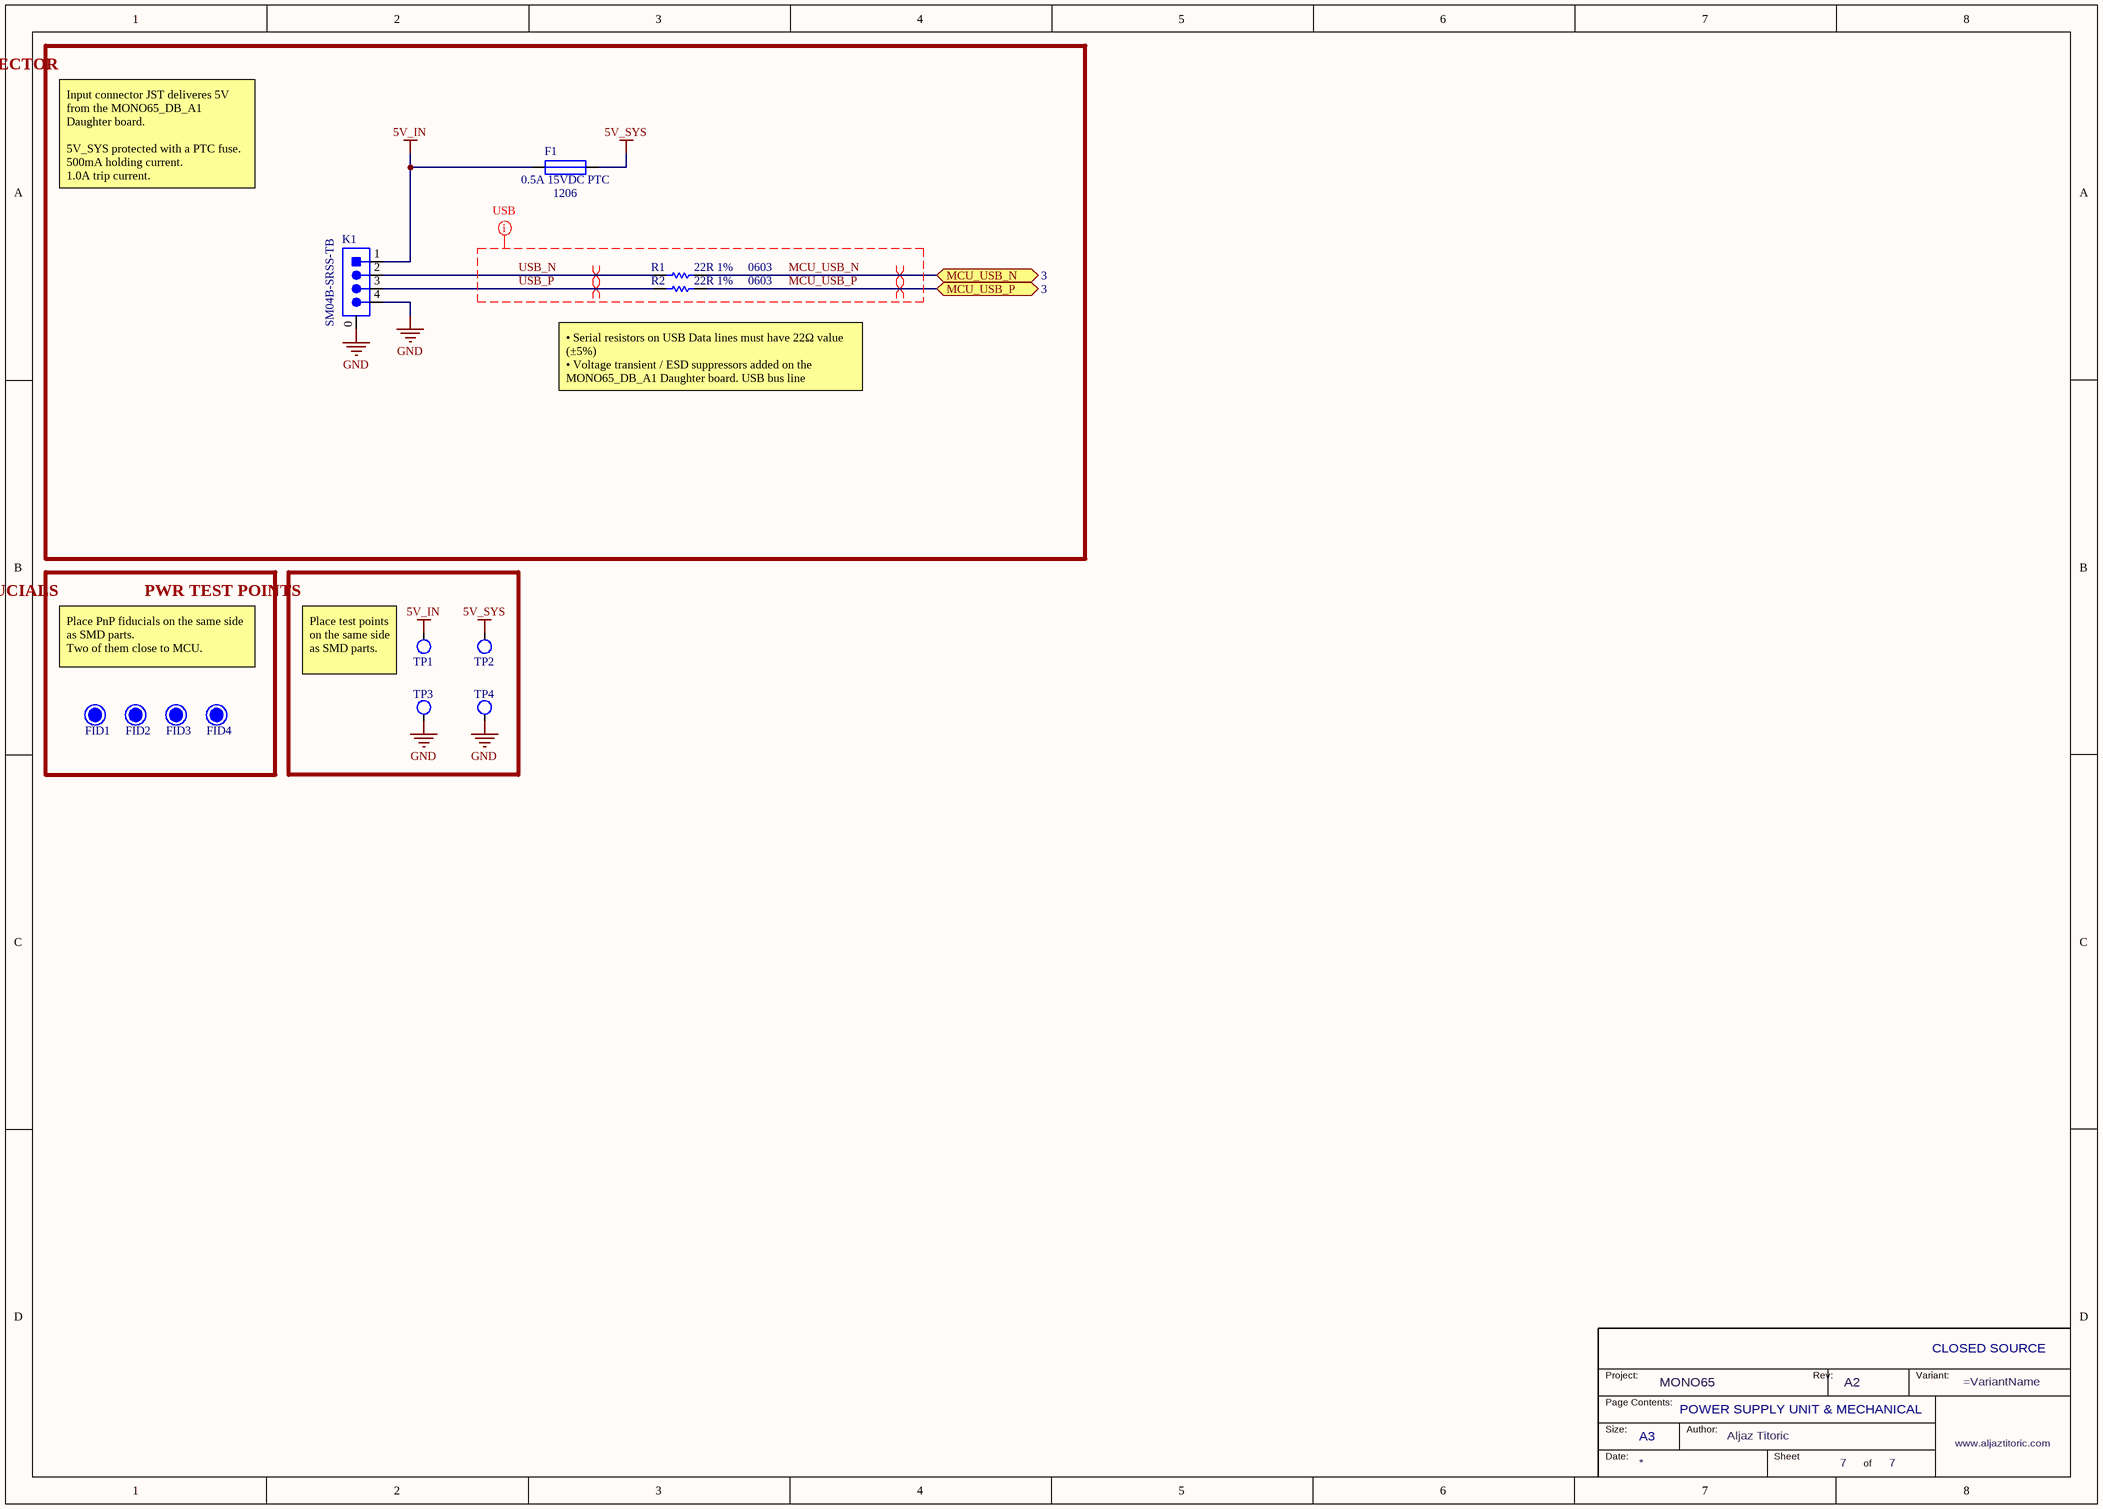
[diagram p6: MONO65_A2_s07 [PSU].SchDoc]

### Parts
(Parts that share a designator on the sheet are numbered #1, #2 ... from top to bottom, then left to right.)
F1  0.5A 15VDC PTC  Case/Package: 1206  [PTC3116X06N]
FID1  FIDUCIAL 1MM  [FID 1mm]  (value not drawn)  (no BOM)
FID2  FIDUCIAL 1MM  [FID 1mm]  (value not drawn)  (no BOM)
FID3  FIDUCIAL 1MM  [FID 1mm]  (value not drawn)  (no BOM)
FID4  FIDUCIAL 1MM  [FID 1mm]  (value not drawn)  (no BOM)
K1  SM04B-SRSS-TB  [SM04B-SRSS-TB]
R1  22R 1%  Case/Package: 0603  [RESC1608X04N]
R2  22R 1%  Case/Package: 0603  [RESC1608X04N]
TB*?#6  PageContents: POWER SUPPLY UNIT & MECHANICAL  Licence: CLOSED SOURCE  Size: A3  (hidden comment: TBL TitleBlock 01)  (graphical)
TP1  TP SMD 0.6mm  [TP SMD 0.6mm]  (value not drawn)  (no BOM)
TP2  TP SMD 0.6mm  [TP SMD 0.6mm]  (value not drawn)  (no BOM)
TP3  TP SMD 0.6mm  [TP SMD 0.6mm]  (value not drawn)  (no BOM)
TP4  TP SMD 0.6mm  [TP SMD 0.6mm]  (value not drawn)  (no BOM)

### Blocks framed on the sheet
INPUT CONNECTOR: F1 K1 R1 R2
PNP FIDUCIALS: FID1-FID4
PWR TEST POINTS: TP1-TP4

### Ports
MCU_USB_N (bidir, see 3), MCU_USB_P (bidir, see 3)

### Nets
5V_IN: F1.1 K1.1 TP1.1
5V_SYS: F1.2 TP2.1
GND: K1.0 K1.4 TP3.1 TP4.1
MCU_USB_N: R1.2 ; port MCU_USB_N
MCU_USB_P: R2.2 ; port MCU_USB_P
USB_N: K1.2 R1.1
USB_P: K1.3 R2.1

### Layout directives
differential pair; differential pair class DIFF_90Ohm_USB: MCU_USB_N, MCU_USB_P, USB_N, USB_P
net class USB: MCU_USB_N, MCU_USB_P, USB_N, USB_P

### Notes on the sheet
- Input connector JST deliveres 5V from the MONO65_DB_A1 Daughter board.
  5V_SYS protected with a PTC fuse.
  500mA holding current.
  1.0A trip current.
- • Serial resistors on USB Data lines must have 22Ω value (±5%)
  • Voltage transient / ESD suppressors added on the MONO65_DB_A1 Daughter board. USB bus line
- Place PnP fiducials on the same side as SMD parts.
  Two of them close to MCU.
- (near TP1) Place test points on the same side as SMD parts.
- (in symbol TBL TitleBlock 01) Project:; Rev:; Variant:; Page Contents:; Size:; Author:; Date:; Sheet; of

### Library data of the parts
F1 = FUS FUS 1206 15VDC 0.5A PTC 1206L050/15YR: PTC Resettable Fuse 0.5A (hold) 1A (trip) 15VDC 100A peak 0.6W 0.1sek 0.15Ohm SMD 1206; Manufacturer: Littelfuse; Resistance: 750mR; Max Voltage Rating (DC): 15V; Power Dissipation: 600mW; Hold Current: 500mA; Time to Trip: 0.1s; Approvals: cULus,TUV; Supplier 1: Digi-Key; Manufacturer Part Number: 1206L050/15YR; Stock 1: 3891; Pricing 1: 1 = 0,49000, 5 = 0,47200, 10 = 0,45700, 50 = 0,38480, 100 = 0,31940, 250 = 0,29040, 500 = 0,24684, 1000 = 0,21780 (USD); RoHS: Yes; Case Code (Metric): 3216; Case Code (Imperial): 1206; Min Operating Temperature: -40°C; Max Operating Temperature: 85°C; Max Current Rating: 100A; Packaging: Tape and Reel; Current Rating: 100A; Package Quantity: 4000; Termination: SMD/SMT; Working Voltage: 15V; Voltage Rating (DC): 15V; Operating Supply Voltage: 15V; Trip Current: 1A; Series: POLY-FUSE®, 1206L; Lead Free: Lead Free; RoHS Compliant: Yes; ComponentLink1URL: https://datasheet.ciiva.com/14102/1206l-eng-datasheet-14102822.pdf?src-supplier=Distrelec; ComponentLink1Description: https://datasheet.ciiva.com/14102/1206l-eng-datasheet-14102822.pdf?src-supplier=Distrelec; ComponentLink2URL: https://datasheet.ciiva.com/16321/littelfuse-1206l-16321387.pdf?src-supplier=Future+Electronics; ComponentLink2Description: https://datasheet.ciiva.com/16321/littelfuse-1206l-16321387.pdf?src-supplier=Future+Electronics; ComponentLink3URL: https://datasheet.ciiva.com/325/littelfuse-ptc-1206l-325756.pdf?src-supplier=Digi-Key; ComponentLink3Description: https://datasheet.ciiva.com/325/littelfuse-ptc-1206l-325756.pdf?src-supplier=Digi-Key; ComponentLink4URL: https://datasheet.ciiva.com/325/littelfuse-ptc-1206l-325757.pdf?src-supplier=Digi-Key; ComponentLink4Description: https://datasheet.ciiva.com/325/littelfuse-ptc-1206l-325757.pdf?src-supplier=Digi-Key; ComponentLink5URL: https://datasheet.ciiva.com/325/littelfuse-ptc-1206l-325758.pdf?src-supplier=Digi-Key; ComponentLink5Description: https://datasheet.ciiva.com/325/littelfuse-ptc-1206l-325758.pdf?src-supplier=Digi-Key; Supplier Part Number 1: F3733CT-ND
FID1-FID4 = FID 1MM: P&P Fiducial point, 1mm diameter
K1 = CON B2W HYB B2B SM04B-SRSS-TB: 4pin PHD 1mm SMD JST - SM04B-SRSS-TB - Pin Header, Wire-to-Board, 1 Rows, 4 Contacts, SR Series; Connector Type: Header,Male Pin; Number of Positions: 4; Voltage Rating: 50V; Gender: Male; Supplier 1: Digi-Key; Manufacturer: JST; Manufacturer Part Number: SM04B-SRSS-TB; Stock 1: 0; RoHS: Yes; Mount: Surface Mount; Housing Material: Nylon; Contact Plating: Tin,Lead; Housing Color: Natural; Contact Material: Copper Alloy; Contact Shape: Square; Insulation Material: Nylon; Insulation Color: Natural; Min Operating Temperature: -25°C; Max Operating Temperature: 85°C; Number of Rows: 1; Packaging: Cut Tape; Termination: Solder; Orientation: Horizontal; Fastening Type: Push,Pull; Insulation Height: 0.114inch; Lead Free: Contains Lead; Flammability Rating: UL94 V-0; REACH SVHC: No SVHC; ComponentLink1URL: https://media.digikey.com/pdf/Data%20Sheets/JST%20PDFs/SR%20Connector.pdf?src-supplier=Digi-Key; ComponentLink1Description: https://media.digikey.com/pdf/Data%20Sheets/JST%20PDFs/SR%20Connector.pdf?src-supplier=Digi-Key; Supplier Part Number 1: 455-1422-1-ND
R1 R2 = RES SMD 22R 1% 0603: SMD RESISTOR 22R 1% 0603 0.1W; Manufacturer: Yageo; Manufacturer Part Number: RC0603FR-0722RL; Temperature Coefficient: 100ppm/°C; Voltage Rating (DC): 50V; Power Rating: 100mW; Supplier 1: Digi-Key; Stock 1: 829965; Pricing 1: 1 = 0,10000, 10 = 0,02400, 100 = 0,00970, 1000 = 0,00436, 2500 = 0,00378 (USD); RoHS: Yes; Number of Pins: 2; Case Code (Metric): 1608; Case Code (Imperial): 0603; Size Code: 0603; Min Operating Temperature: -55°C; Max Operating Temperature: 155°C; Tolerance: 1%; Resistance: 22R; Resistor Type: Thick Film; Packaging: Tape and Reel; Voltage Rating: 50V; Package Quantity: 1; Number of Terminations: 2; Termination: SMD/SMT; Max Power Dissipation: 100mW; Features: Moisture Resistant; Series: RC; Resistance Tolerance: 1%; Technology: THICK FILM; Construction: Rectangular; Length: 1.6mm; Width: 0.031inch; Height: 0.022inch; Depth: 0.8mm; REACH SVHC: No SVHC; Lead Free: Lead Free; Military Standard: Not; RoHS Compliant: Yes; ComponentLink1URL: https://datasheet.ciiva.com/11819/0900766b80f96399-11819285.pdf?src-supplier=RSComponents; ComponentLink1Description: https://datasheet.ciiva.com/11819/0900766b80f96399-11819285.pdf?src-supplier=RSComponents; ComponentLink2URL: https://datasheet.ciiva.com/2454/pyu-r-int-thick-7-2454354.pdf?src-supplier=Digi-Key; ComponentLink2Description: https://datasheet.ciiva.com/2454/pyu-r-int-thick-7-2454354.pdf?src-supplier=Digi-Key; ComponentLink3URL: https://datasheet.ciiva.com/2454/pyu-r-int-thick-7-2454355.pdf?src-supplier=Digi-Key; ComponentLink3Description: https://datasheet.ciiva.com/2454/pyu-r-int-thick-7-2454355.pdf?src-supplier=Digi-Key; ComponentLink4URL: https://datasheet.ciiva.com/2454/pyu-r-int-thick-7-2454356.pdf?src-supplier=Digi-Key; ComponentLink4Description: https://datasheet.ciiva.com/2454/pyu-r-int-thick-7-2454356.pdf?src-supplier=Digi-Key; ComponentLink5URL: https://datasheet.ciiva.com/46440/1868787-46440901.pdf?src-supplier=Element14; ComponentLink5Description: https://datasheet.ciiva.com/46440/1868787-46440901.pdf?src-supplier=Element14; ComponentLink6URL: https://datasheet.ciiva.com/46395/443971-46395032.pdf?src-supplier=Element14; ComponentLink6Description: https://datasheet.ciiva.com/46395/443971-46395032.pdf?src-supplier=Element14; Supplier Part Number 1: 311-22.0HRCT-ND
TB*?#6 = TBL TitleBlock 01: Custom Title block
TP1-TP4 = TPT SMD 60: Test Point SMD 0.6mm

## Nets that join several sheets
5V_SYS: MONO65_A2_s03 [MCU] (5 pins), MONO65_A2_s06 [LEDs] (R10.1 R94.1), MONO65_A2_s07 [PSU] (F1.2 TP2.1)
GND: MONO65_A2_s03 [MCU] (22 pins), MONO65_A2_s06 [LEDs] (9 pins), MONO65_A2_s07 [PSU] (K1.0 K1.4 TP3.1 TP4.1)
MCU_BCKLT_PWM: MONO65_A2_s03 [MCU] (IC1.17), MONO65_A2_s06 [LEDs] (R13.1 R14.1 TP11.1)
MCU_CPSLCK_PWM: MONO65_A2_s03 [MCU] (IC1.16), MONO65_A2_s06 [LEDs] (R15.1 R16.1)
MCU_USB_N: MONO65_A2_s03 [MCU] (IC1.4), MONO65_A2_s07 [PSU] (R1.2)
MCU_USB_P: MONO65_A2_s03 [MCU] (IC1.5), MONO65_A2_s07 [PSU] (R2.2)
MTRX_C0: MONO65_A2_s03 [MCU] (IC1.32), MONO65_A2_s04 [Switches-1] (8 pins)
MTRX_C1: MONO65_A2_s03 [MCU] (IC1.49), MONO65_A2_s04 [Switches-1] (6 pins)
MTRX_C2: MONO65_A2_s03 [MCU] (IC1.35), MONO65_A2_s04 [Switches-1] (6 pins)
MTRX_C3: MONO65_A2_s03 [MCU] (IC1.36), MONO65_A2_s04 [Switches-1] (SW4.2 SW21.2 SW37.2 SW54.2)
MTRX_C4: MONO65_A2_s03 [MCU] (IC1.37), MONO65_A2_s04 [Switches-1] (SW5.2 SW22.2 SW38.2 SW55.2)
MTRX_C5: MONO65_A2_s03 [MCU] (IC1.38), MONO65_A2_s04 [Switches-1] (SW6.2 SW23.2 SW39.2 SW56.2)
MTRX_C6: MONO65_A2_s03 [MCU] (IC1.39), MONO65_A2_s04 [Switches-1] (6 pins)
MTRX_C7: MONO65_A2_s03 [MCU] (IC1.44), MONO65_A2_s04 [Switches-1] (SW8.2 SW25.2 SW41.2 SW58.2)
MTRX_C8: MONO65_A2_s03 [MCU] (IC1.45), MONO65_A2_s04 [Switches-1] (SW9.2 SW26.2 SW42.2 SW59.2)
MTRX_C9: MONO65_A2_s03 [MCU] (IC1.46), MONO65_A2_s04 [Switches-1] (SW10.2 SW27.2 SW43.2 SW60.2)
MTRX_C10: MONO65_A2_s03 [MCU] (IC1.47), MONO65_A2_s04 [Switches-1] (5 pins)
MTRX_C11: MONO65_A2_s03 [MCU] (IC1.48), MONO65_A2_s04 [Switches-1] (6 pins)
MTRX_C12: MONO65_A2_s03 [MCU] (IC1.50), MONO65_A2_s04 [Switches-1] (6 pins)
MTRX_C13: MONO65_A2_s03 [MCU] (IC1.55), MONO65_A2_s04 [Switches-1] (7 pins)
MTRX_C14: MONO65_A2_s03 [MCU] (IC1.54), MONO65_A2_s04 [Switches-1] (5 pins)
MTRX_R0: MONO65_A2_s03 [MCU] (IC1.28), MONO65_A2_s04 [Switches-1] (15 pins)
MTRX_R1: MONO65_A2_s03 [MCU] (IC1.29), MONO65_A2_s04 [Switches-1] (15 pins)
MTRX_R2: MONO65_A2_s03 [MCU] (IC1.57), MONO65_A2_s04 [Switches-1] (15 pins)
MTRX_R3: MONO65_A2_s03 [MCU] (IC1.59), MONO65_A2_s04 [Switches-1] (15 pins)
MTRX_R4: MONO65_A2_s03 [MCU] (IC1.60), MONO65_A2_s04 [Switches-1] (9 pins)

## Assembly variants
FULL_Var_SCH: all parts fitted
NO_SWITCHES: not fitted SW1 SW2 SW3 SW4 SW5 SW6 SW7 SW8 SW9 SW10 SW11 SW12 SW13 SW14 SW15 SW16 SW17 SW18 SW19 SW20 SW21 SW22 SW23 SW24 SW25 SW26 SW27 SW28 SW29 SW30 SW31 SW32 SW33 SW34 SW35 SW36 SW37 SW38 SW39 SW40 SW41 SW42 SW43 SW44 SW45 SW46 SW47 SW48 SW49 SW50 SW51 SW52 SW53 SW54 SW55 SW56 SW57 SW58 SW59 SW60 SW61 SW62 SW63 SW64 SW65 SW66 SW67 SW68 SW69 SW70 SW71 SW72 SW73 SW74 SW75 SW76 SW77 SW78 SW79